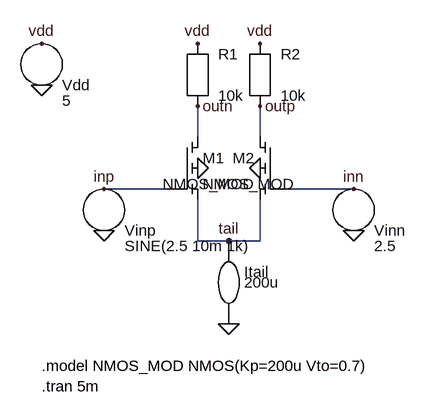
[diagram p0: schematic diff_pair_drawn.asc]
diff_pair_drawn.asc, the LTspice schematic file:
Version 4
SHEET 1 880 680
WIRE 304 416 304 480
WIRE 304 480 352 480
WIRE 400 416 400 480
WIRE 400 480 352 480
WIRE 304 272 304 320
WIRE 400 272 400 320
WIRE 160 400 256 400
WIRE 544 400 448 400
FLAG 64 176 vdd
FLAG 304 176 vdd
FLAG 400 176 vdd
FLAG 160 400 inp
FLAG 544 400 inn
FLAG 304 272 outn
FLAG 400 272 outp
FLAG 352 480 tail
FLAG 64 240 0
FLAG 160 464 0
FLAG 544 464 0
FLAG 304 368 0
FLAG 400 368 0
FLAG 352 608 0
SYMBOL nmos4 256 320 R0
SYMATTR InstName M1
SYMATTR Value NMOS_MOD
SYMBOL nmos4 448 320 M0
SYMATTR InstName M2
SYMATTR Value NMOS_MOD
SYMBOL current 352 528 R0
SYMATTR InstName Itail
SYMATTR Value 200u
SYMBOL res 304 224 R0
SYMATTR InstName R1
SYMATTR Value 10k
SYMBOL res 400 224 R0
SYMATTR InstName R2
SYMATTR Value 10k
SYMBOL voltage 160 432 R0
SYMATTR InstName Vinp
SYMATTR Value SINE(2.5 10m 1k)
SYMBOL voltage 544 432 R0
SYMATTR InstName Vinn
SYMATTR Value 2.5
SYMBOL voltage 64 208 R0
SYMATTR InstName Vdd
SYMATTR Value 5
TEXT 64 672 Left 2 !.model NMOS_MOD NMOS(Kp=200u Vto=0.7)
TEXT 64 704 Left 2 !.tran 5m

The netlist it stands for:
* diff_pair_drawn.asc
M1 outn inp tail 0 NMOS_MOD
M2 outp inn tail 0 NMOS_MOD
Itail tail 0 200u
R1 vdd outn 10k
R2 vdd outp 10k
Vinp inp 0 SINE(2.5 10m 1k)
Vinn inn 0 2.5
Vdd vdd 0 5
.model NMOS NMOS
.model PMOS PMOS
.lib standard.mos
.model NMOS_MOD NMOS(Kp=200u Vto=0.7)
.tran 5m
.backanno
.end